# Altium schematic sheet 856_Peleng.SchDoc
size A4
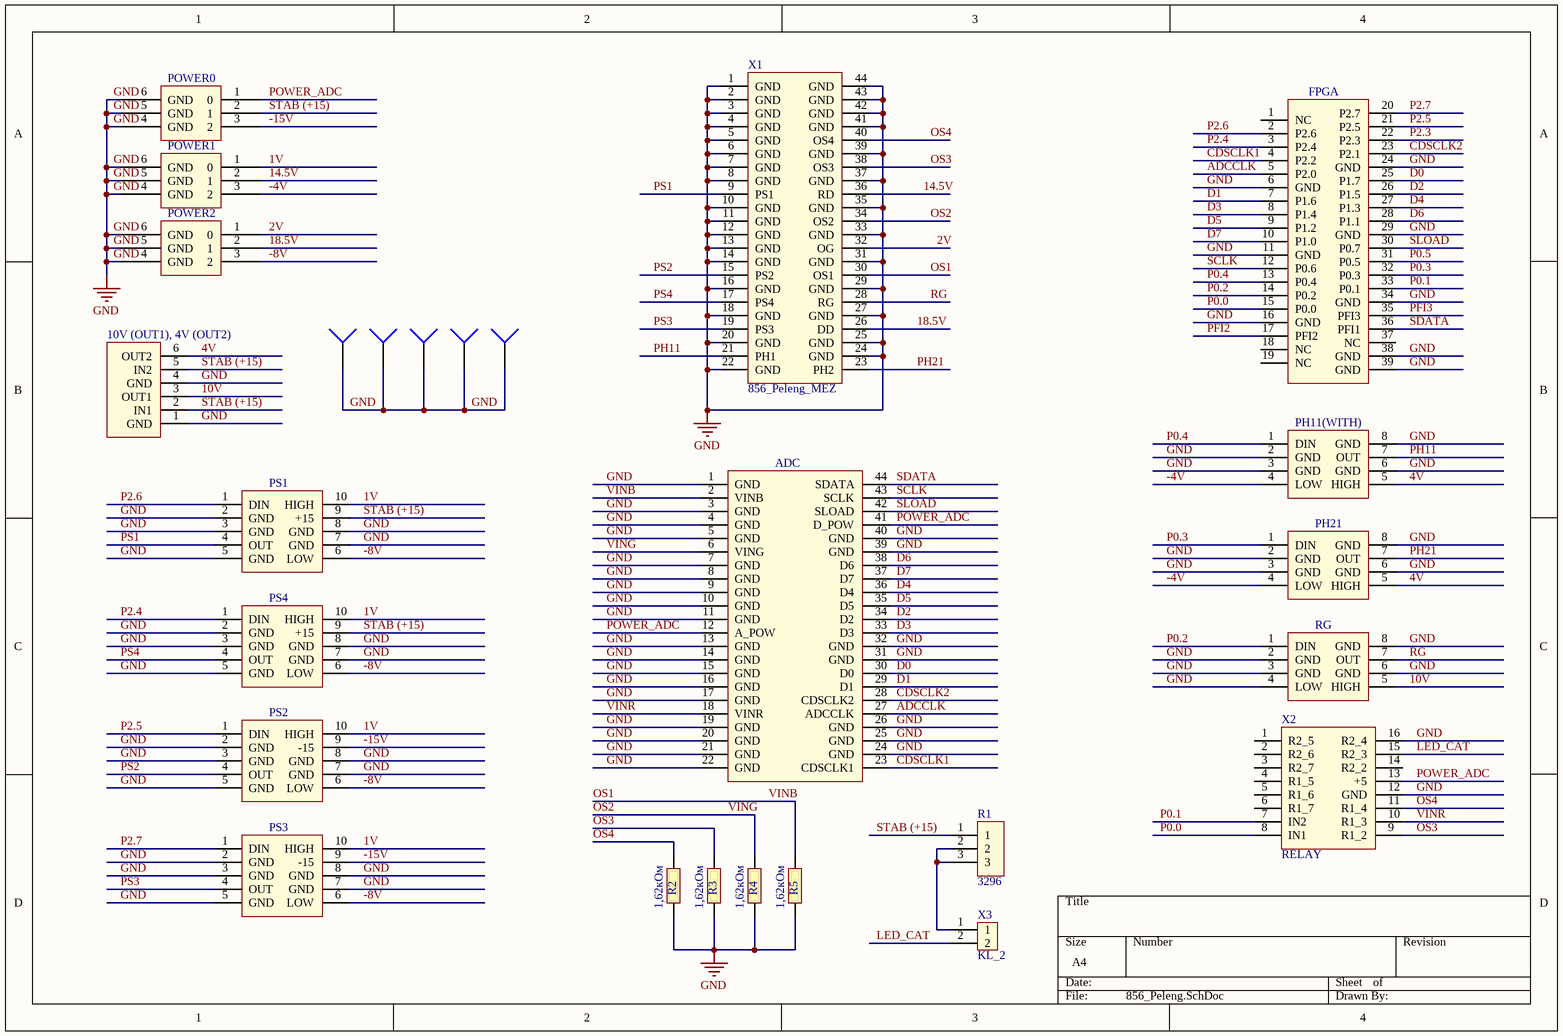
[diagram p0: 856_Peleng.SchDoc]

## Parts
10V_(OUT1),_4V_(OUT2)  MEZ_POWER  [MEZON_POWER_NEW]  (value not drawn)
ADC  MEZON_ADC  [MEZON_ADC]  (value not drawn)
FPGA  CHEAP_CON_37_FEMALE  [CHEAP_CONN_FEMALE]  (value not drawn)
J1  Socket  [PIN1]  (value not drawn)
J2  Socket  [PIN1]  (value not drawn)
J3  Socket  [PIN1]  (value not drawn)
J4  Socket  [PIN1]  (value not drawn)
J5  Socket  [PIN1]  (value not drawn)
PH11(WITH)  MEZON_H  [MEZON_H]  (value not drawn)
PH21  MEZON_H  [MEZON_H]  (value not drawn)
POWER0  POWER  [POWER]  (value not drawn)
POWER1  POWER  [POWER]  (value not drawn)
POWER2  POWER  [POWER]  (value not drawn)
PS1  MEZON_V+15  [MEZON_V]  (value not drawn)
PS2  MEZON_V  [MEZON_V]  (value not drawn)
PS3  MEZON_V  [MEZON_V]  (value not drawn)
PS4  MEZON_V+15  [MEZON_V]  (value not drawn)
R1  3296  [PODSTR_RES_3296]
R2  1,62кОм  [RES]
R3  1,62кОм  [RES]
R4  1,62кОм  [RES]
R5  1,62кОм  [RES]
RG  MEZON_H  [MEZON_H]  (value not drawn)
X1  856_Peleng_MEZ  [856_Peleng_MEZ]
X2  RELAY  [RELAY_MODULE]
X3  KL_2  [KLEMMNIK_2]

## Nets
GND: 10V_(OUT1),_4V_(OUT2).1(GND) 10V_(OUT1),_4V_(OUT2).4(GND) ADC.1(GND) ADC.3(GND) ADC.4(GND) ADC.5(GND) ADC.7(GND) ADC.8(GND) ADC.9(GND) ADC.10(GND) ADC.11(GND) ADC.13(GND) ADC.14(GND) ADC.15(GND) ADC.16(GND) ADC.17(GND) ADC.19(GND) ADC.20(GND) ADC.21(GND) ADC.22(GND) ADC.24(GND) ADC.25(GND) ADC.26(GND) ADC.31(GND) ADC.32(GND) ADC.39(GND) ADC.40(GND) FPGA.6(GND) FPGA.11(GND) FPGA.16(GND) FPGA.24(GND) FPGA.29(GND) FPGA.34(GND) FPGA.38(GND) FPGA.39(GND) J1.1 J2.1 J3.1 J4.1 J5.1 PH11(WITH).2(GND) PH11(WITH).3(GND) PH11(WITH).6(GND) PH11(WITH).8(GND) PH21.2(GND) PH21.3(GND) PH21.6(GND) PH21.8(GND) POWER0.4(GND) POWER0.5(GND) POWER0.6(GND) POWER1.4(GND) POWER1.5(GND) POWER1.6(GND) POWER2.4(GND) POWER2.5(GND) POWER2.6(GND) PS1.2(GND) PS1.3(GND) PS1.5(GND) PS1.7(GND) PS1.8(GND) PS2.2(GND) PS2.3(GND) PS2.5(GND) PS2.7(GND) PS2.8(GND) PS3.2(GND) PS3.3(GND) PS3.5(GND) PS3.7(GND) PS3.8(GND) PS4.2(GND) PS4.3(GND) PS4.5(GND) PS4.7(GND) PS4.8(GND) R2.1 R3.1 R4.1 R5.1 RG.2(GND) RG.3(GND) RG.4(LOW) RG.6(GND) RG.8(GND) X1.1(GND) X1.2(GND) X1.3(GND) X1.4(GND) X1.5(GND) X1.6(GND) X1.7(GND) X1.8(GND) X1.10(GND) X1.11(GND) X1.12(GND) X1.13(GND) X1.14(GND) X1.16(GND) X1.18(GND) X1.20(GND) X1.22(GND) X1.24(GND) X1.25(GND) X1.27(GND) X1.29(GND) X1.31(GND) X1.33(GND) X1.35(GND) X1.37(GND) X1.39(GND) X1.41(GND) X1.42(GND) X1.43(GND) X1.44(GND) X2.12(GND) X2.16(R2_4)
1V: POWER1.1(0) PS1.10(HIGH) PS2.10(HIGH) PS3.10(HIGH) PS4.10(HIGH)
2V: POWER2.1(0) X1.32(OG)
4V: 10V_(OUT1),_4V_(OUT2).6(OUT2) PH11(WITH).5(HIGH) PH21.5(HIGH)
10V: 10V_(OUT1),_4V_(OUT2).3(OUT1) RG.5(HIGH)
14.5V: POWER1.2(1) X1.36(RD)
18.5V: POWER2.2(1) X1.26(DD)
-4V: PH11(WITH).4(LOW) PH21.4(LOW) POWER1.3(2)
-8V: POWER2.3(2) PS1.6(LOW) PS2.6(LOW) PS3.6(LOW) PS4.6(LOW)
-15V: POWER0.3(2) PS2.9(-15) PS3.9(-15)
ADCCLK: ADC.27(ADCCLK) FPGA.5(P2.0)
CDSCLK1: ADC.23(CDSCLK1) FPGA.4(P2.2)
CDSCLK2: ADC.28(CDSCLK2) FPGA.23(P2.1)
D0: ADC.30(D0) FPGA.25(P1.7)
D1: ADC.29(D1) FPGA.7(P1.6)
D2: ADC.34(D2) FPGA.26(P1.5)
D3: ADC.33(D3) FPGA.8(P1.4)
D4: ADC.36(D4) FPGA.27(P1.3)
D5: ADC.35(D5) FPGA.9(P1.2)
D6: ADC.38(D6) FPGA.28(P1.1)
D7: ADC.37(D7) FPGA.10(P1.0)
LED_CAT: X2.15(R2_3) X3.2
OS1: ADC.2(VINB) R5.2 X1.30(OS1)  [also labelled VINB]
OS2: ADC.6(VING) R4.2 X1.34(OS2)  [also labelled VING]
OS3: R3.2 X1.38(OS3) X2.9(R1_2)
OS4: R2.2 X1.40(OS4) X2.11(R1_4)
P0.0: FPGA.15(P0.0) X2.8(IN1)
P0.1: FPGA.33(P0.1) X2.7(IN2)
P0.2: FPGA.14(P0.2) RG.1(DIN)
P0.3: FPGA.32(P0.3) PH21.1(DIN)
P0.4: FPGA.13(P0.4) PH11(WITH).1(DIN)
P0.5: FPGA.31(P0.5)
P2.3: FPGA.22(P2.3)
P2.4: FPGA.3(P2.4) PS4.1(DIN)
P2.5: FPGA.21(P2.5) PS2.1(DIN)
P2.6: FPGA.2(P2.6) PS1.1(DIN)
P2.7: FPGA.20(P2.7) PS3.1(DIN)
PFI2: FPGA.17(PFI2)
PFI3: FPGA.35(PFI3)
PH11: PH11(WITH).7(OUT) X1.21(PH1)
PH21: PH21.7(OUT) X1.23(PH2)
POWER_ADC: ADC.12(A_POW) ADC.41(D_POW) POWER0.1(0) X2.13(+5)
PS1: PS1.4(OUT) X1.9(PS1)
PS2: PS2.4(OUT) X1.15(PS2)
PS3: PS3.4(OUT) X1.19(PS3)
PS4: PS4.4(OUT) X1.17(PS4)
RG: RG.7(OUT) X1.28(RG)
SCLK: ADC.43(SCLK) FPGA.12(P0.6)
SDATA: ADC.44(SDATA) FPGA.36(PFI1)
SLOAD: ADC.42(SLOAD) FPGA.30(P0.7)
STAB (+15): 10V_(OUT1),_4V_(OUT2).2(IN1) 10V_(OUT1),_4V_(OUT2).5(IN2) POWER0.2(1) PS1.9(+15) PS4.9(+15) R1.1
VINR: ADC.18(VINR) X2.10(R1_3)
NetR1_2: R1.2 R1.3 X3.1

Not connected (* = marked no-connect by the designer): FPGA 1(NC) 18(NC) 19(NC) 37(NC); X2 1(R2_5) 2(R2_6) 3(R2_7) 4(R1_5) 5(R1_6) 6(R1_7) 14(R2_2)

## Library data of the parts
10V_(OUT1),_4V_(OUT2) = MEZON_POWER_NEW
PS1 PS4 = MEZON_V_+15
R1 = PODSTR_RES_NEW
R2-R5 = RES
X2 = MEZON_RELAY
X3 = KLEMMNIK_2
J1-J5 = Socket: LatestRevisionDate: 17-Jul-2002; LatestRevisionNote: Re-released for DXP Platform.; Publisher: Altium Limited